# Altium schematic sheet PAB.SchDoc
size 420 x 297 mm; SheetNumber: 3; SheetTotal: 5
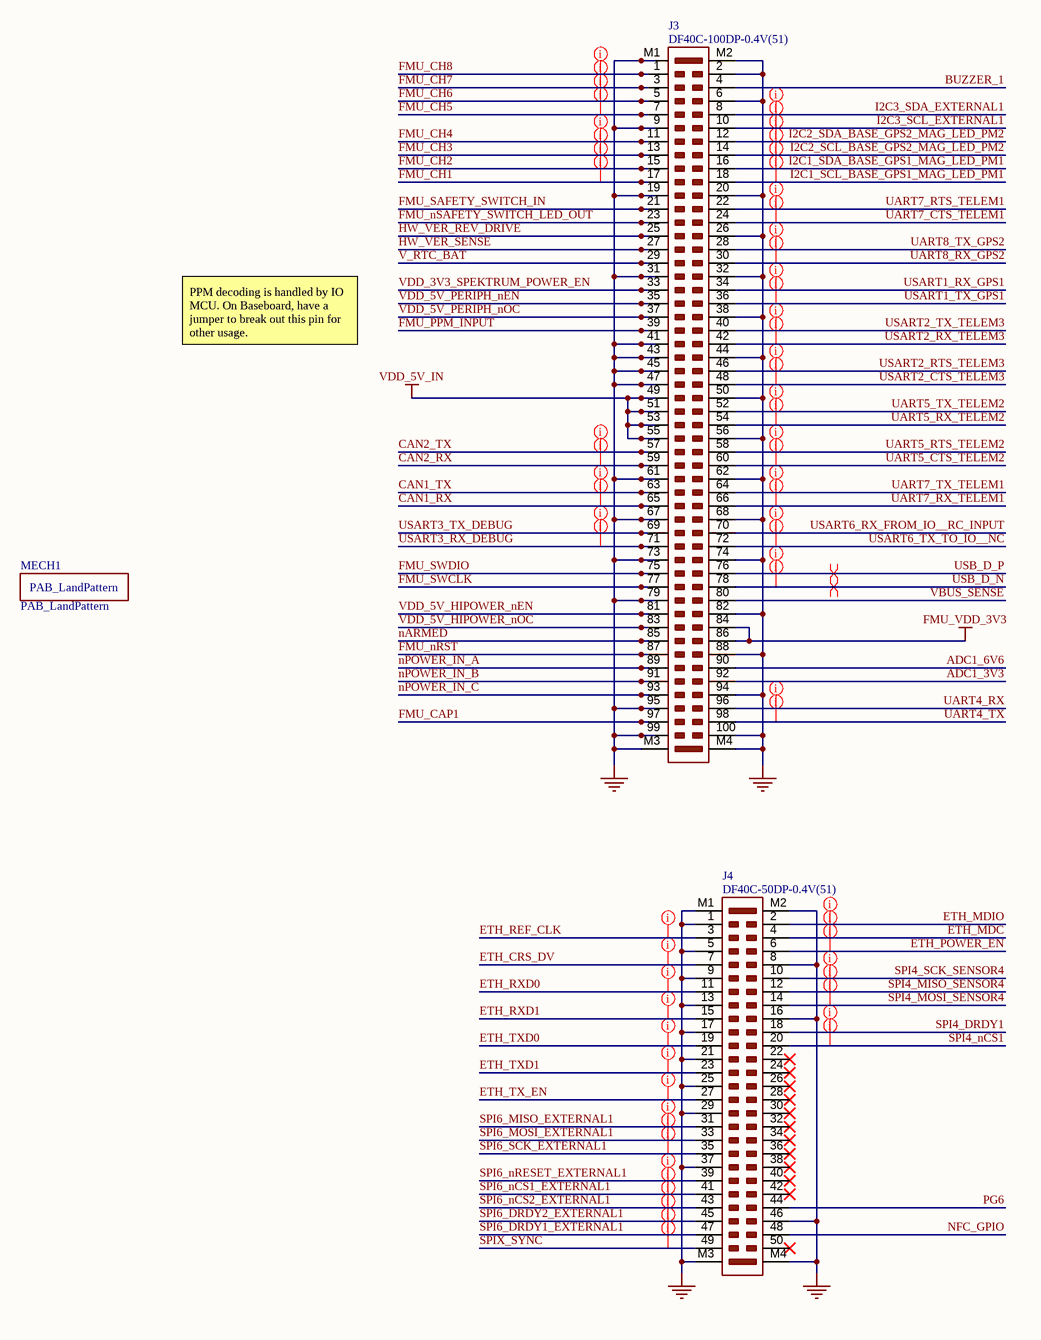
[diagram p0: PAB.SchDoc]

## Parts
J3  Manufacturer Part Number: DF40C-100DP-0.4V(51)  [HIROSE_DF40C-100DP-0_4V51]  (hidden comment: CONN HDR 100POS 0.4MM SMD GOLD)
J4  Manufacturer Part Number: DF40C-50DP-0.4V(51)  [HIROSE_DF40C-50DP-0-4V51]  (hidden comment: CONN HDR 50POS 0.4MM SMD GOLD)
MECH1  PAB_LandPattern  [PAB_LandPattern]  (mechanical)

## Nets
FMU_VDD_3V3: J3.84 J3.86
GND: J3.2 J3.6 J3.9 J3.19 J3.20 J3.26 J3.31 J3.32 J3.38 J3.41 J3.43 J3.44 J3.45 J3.47 J3.50 J3.56 J3.61 J3.62 J3.67 J3.68 J3.73 J3.74 J3.79 J3.82 J3.88 J3.94 J3.95 J3.99 J3.100 J3.M1 J3.M2 J3.M3 J3.M4 J4.1 J4.5 J4.8 J4.9 J4.13 J4.16 J4.17 J4.21 J4.25 J4.29 J4.37 J4.46 J4.M1 J4.M2 J4.M3 J4.M4
VDD_5V_IN: J3.49 J3.51 J3.53 J3.55
ADC1_3V3: J3.92
ADC1_6V6: J3.90
BUZZER_1: J3.4
CAN1_RX: J3.65
CAN1_TX: J3.63
CAN2_RX: J3.59
CAN2_TX: J3.57
ETH_CRS_DV: J4.7
ETH_MDC: J4.4
ETH_MDIO: J4.2
ETH_POWER_EN: J4.6
ETH_REF_CLK: J4.3
ETH_RXD0: J4.11
ETH_RXD1: J4.15
ETH_TX_EN: J4.27
ETH_TXD0: J4.19
ETH_TXD1: J4.23
FMU_CAP1: J3.97
FMU_CH1: J3.17
FMU_CH2: J3.15
FMU_CH3: J3.13
FMU_CH4: J3.11
FMU_CH5: J3.7
FMU_CH6: J3.5
FMU_CH7: J3.3
FMU_CH8: J3.1
FMU_nRST: J3.87
FMU_nSAFETY_SWITCH_LED_OUT: J3.23
FMU_PPM_INPUT: J3.39
FMU_SAFETY_SWITCH_IN: J3.21
FMU_SWCLK: J3.77
FMU_SWDIO: J3.75
HW_VER_REV_DRIVE: J3.25
HW_VER_SENSE: J3.27
I2C1_SCL_BASE_GPS1_MAG_LED_PM1: J3.18
I2C1_SDA_BASE_GPS1_MAG_LED_PM1: J3.16
I2C2_SCL_BASE_GPS2_MAG_LED_PM2: J3.14
I2C2_SDA_BASE_GPS2_MAG_LED_PM2: J3.12
I2C3_SCL_EXTERNAL1: J3.10
I2C3_SDA_EXTERNAL1: J3.8
nARMED: J3.85
NFC_GPIO: J4.48
nPOWER_IN_A: J3.89
nPOWER_IN_B: J3.91
nPOWER_IN_C: J3.93
PG6: J4.44
SPI4_DRDY1: J4.18
SPI4_MISO_SENSOR4: J4.12
SPI4_MOSI_SENSOR4: J4.14
SPI4_nCS1: J4.20
SPI4_SCK_SENSOR4: J4.10
SPI6_DRDY1_EXTERNAL1: J4.47
SPI6_DRDY2_EXTERNAL1: J4.45
SPI6_MISO_EXTERNAL1: J4.31
SPI6_MOSI_EXTERNAL1: J4.33
SPI6_nCS1_EXTERNAL1: J4.41
SPI6_nCS2_EXTERNAL1: J4.43
SPI6_nRESET_EXTERNAL1: J4.39
SPI6_SCK_EXTERNAL1: J4.35
SPIX_SYNC: J4.49
UART4_RX: J3.96
UART4_TX: J3.98
UART5_CTS_TELEM2: J3.60
UART5_RTS_TELEM2: J3.58
UART5_RX_TELEM2: J3.54
UART5_TX_TELEM2: J3.52
UART7_CTS_TELEM1: J3.24
UART7_RTS_TELEM1: J3.22
UART7_RX_TELEM1: J3.66
UART7_TX_TELEM1: J3.64
UART8_RX_GPS2: J3.30
UART8_TX_GPS2: J3.28
USART1_RX_GPS1: J3.34
USART1_TX_GPS1: J3.36
USART2_CTS_TELEM3: J3.48
USART2_RTS_TELEM3: J3.46
USART2_RX_TELEM3: J3.42
USART2_TX_TELEM3: J3.40
USART3_RX_DEBUG: J3.71
USART3_TX_DEBUG: J3.69
USART6_RX_FROM_IO__RC_INPUT: J3.70
USART6_TX_TO_IO__NC: J3.72
USB_D_N: J3.78
USB_D_P: J3.76
V_RTC_BAT: J3.29
VBUS_SENSE: J3.80
VDD_3V3_SPEKTRUM_POWER_EN: J3.33
VDD_5V_HIPOWER_nEN: J3.81
VDD_5V_HIPOWER_nOC: J3.83
VDD_5V_PERIPH_nEN: J3.35
VDD_5V_PERIPH_nOC: J3.37

Not connected (* = marked no-connect by the designer): J4 22* 24* 26* 28* 30* 32* 34* 36* 38* 40* 42* 50*

## Layout directives
net class PWM; net class PWM: FMU_CH8
net class PWM: FMU_CH1, FMU_CH2, FMU_CH3, FMU_CH4, FMU_CH5, FMU_CH6, FMU_CH7
net class CAN2: CAN2_RX, CAN2_TX
net class CAN1: CAN1_RX, CAN1_TX
net class USART3: USART3_RX_DEBUG, USART3_TX_DEBUG
net class I2C3: I2C3_SCL_EXTERNAL1, I2C3_SDA_EXTERNAL1
net class I2C2: I2C2_SCL_BASE_GPS2_MAG_LED_PM2, I2C2_SDA_BASE_GPS2_MAG_LED_PM2
net class I2C1: I2C1_SCL_BASE_GPS1_MAG_LED_PM1, I2C1_SDA_BASE_GPS1_MAG_LED_PM1
net class UART7: UART7_CTS_TELEM1, UART7_RTS_TELEM1, UART7_RX_TELEM1, UART7_TX_TELEM1
net class UART8: UART8_RX_GPS2, UART8_TX_GPS2
net class USART1: USART1_RX_GPS1, USART1_TX_GPS1
net class USART2: USART2_CTS_TELEM3, USART2_RTS_TELEM3, USART2_RX_TELEM3, USART2_TX_TELEM3
net class UART5: UART5_CTS_TELEM2, UART5_RTS_TELEM2, UART5_RX_TELEM2, UART5_TX_TELEM2
net class USART6: USART6_RX_FROM_IO__RC_INPUT, USART6_TX_TO_IO__NC
net class USB: USB_D_N, USB_D_P
differential pair: USB_D_N, USB_D_P
net class ETH_RMII_TX: ETH_REF_CLK, ETH_TX_EN, ETH_TXD0, ETH_TXD1
net class ETH_RMII_RX: ETH_CRS_DV, ETH_RXD0, ETH_RXD1
net class ETH_RMII_SLOW: ETH_MDC, ETH_MDIO, ETH_POWER_EN
net class SPI4: SPI4_DRDY1, SPI4_MISO_SENSOR4, SPI4_MOSI_SENSOR4, SPI4_nCS1, SPI4_SCK_SENSOR4
net class SPI6: SPI6_DRDY1_EXTERNAL1, SPI6_DRDY2_EXTERNAL1, SPI6_MISO_EXTERNAL1, SPI6_MOSI_EXTERNAL1, SPI6_nCS1_EXTERNAL1, SPI6_nCS2_EXTERNAL1, SPI6_nRESET_EXTERNAL1, SPI6_SCK_EXTERNAL1, SPIX_SYNC
net class UART4: UART4_RX, UART4_TX

## Notes on the sheet
- PPM decoding is handled by IO MCU. On Baseboard, have a jumper to break out this pin for other usage.
- REVISION
- DESCRIPTION
- DATE
- APPROVED
- ENG:
- APPROVALS
- PROJECT
- Xuan Hoa Ward, 72117
- Leman Building
- 20 Truong Dinh
- DSN:
- CHK:
- REFERENCE DOCUMENTS
- PROJECT REVISION:
- TITLE
- DOCUMENT REVISION:
- DESIGN ITEM:
- HCMC, Vietnam
- BOM:
- FAB DWG:
- PCB DWG:
- ASSY DWG:
- FILE NAME
- SIZE
- A3
- DWG NO.
- SHEET
- REV
- OF

## Library data of the parts
J3 = CONN_HDR_2X50_PLUG_0.4MM_SMD: Manufacturer: Hirose Electric Co Ltd; Number of Positions: 100; Pitch: 0.016" (0.40mm); System: Connector; Packaging: Cut Tape (CT); Part Status: Active; Number of Rows: 2; Mounting Type: Surface Mount; Operating Temperature: -65°C ~ 85°C; Supplier 1: Digi-Key; Supplier Part Number 1: H11614CT-ND; Category: Connectors, Interconnects; Stock 1: 27593; Pricing 1: 1=1.96 (USD); ComponentLink1Description: https://www.digikey.com/product-detail/en/hirose-electric-co-ltd/DF40C-100DP-0.4V-51/H11614CT-ND/1969494; ComponentLink1URL: https://www.digikey.com/product-detail/en/hirose-electric-co-ltd/DF40C-100DP-0.4V-51/H11614CT-ND/1969494
J4 = CONN_HDR_2X25_PLUG_0.4MM_SMD: Manufacturer: Hirose Electric Co Ltd; Number of Positions: 50; Pitch: 0.016" (0.40mm); System: Connector; Packaging: Cut Tape (CT); Part Status: Active; Number of Rows: 2; Mounting Type: Surface Mount; Operating Temperature: -65°C ~ 85°C; Supplier 1: Digi-Key; Supplier Part Number 1: H11626CT-ND; Category: Connectors, Interconnects; Stock 1: 57993; Pricing 1: 1=1.12, 10=0.982, 25=0.924, 50=0.8856, 100=0.847, 250=0.77, 500=0.693, 1000=0.616 (USD); ComponentLink1Description: https://www.digikey.com/products/en/connectors-interconnects/rectangular-connectors-arrays-edge-type-mezzanine-board-to-board/308?k=DF40C-50DP-0.4V51&k=&pkeyword=DF40C-50DP-0.4V51&pv7=2&sf=0&quantity=&ColumnSort=0&page=1&pageSize=25; ComponentLink1URL: https://www.digikey.com/products/en/connectors-interconnects/rectangular-connectors-arrays-edge-type-mezzanine-board-to-board/308?k=DF40C-50DP-0.4V51&k=&pkeyword=DF40C-50DP-0.4V51&pv7=2&sf=0&quantity=&ColumnSort=0&page=1&pageSize=25